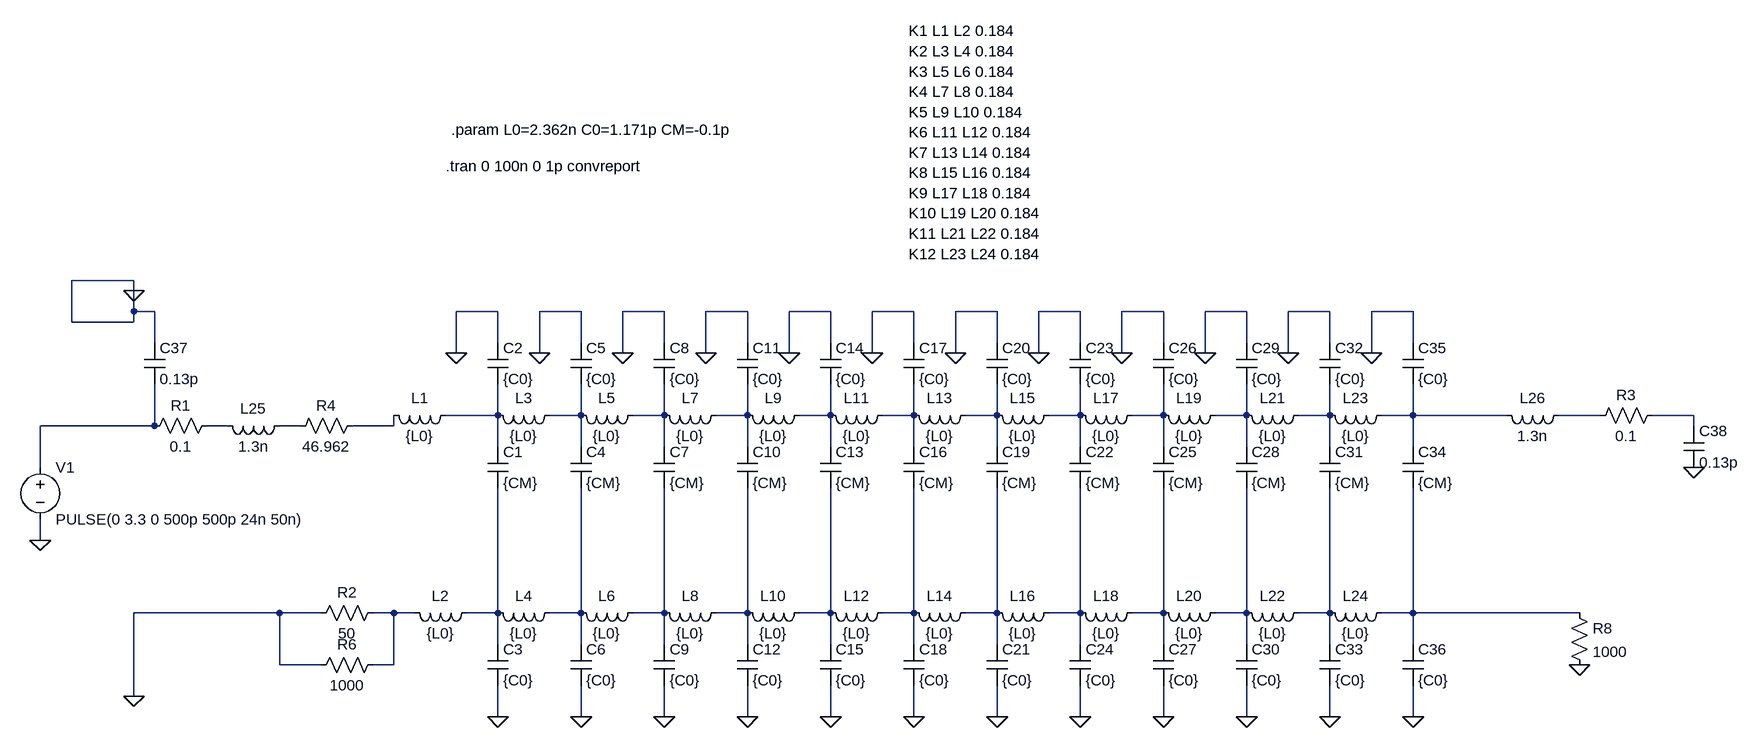
[diagram p0: schematic Assignment1_Microstrip.asc]
Assignment1_Microstrip.asc, the LTspice schematic file:
Version 4.1
SHEET 1 1612 952
WIRE -896 224 -992 224
WIRE -896 240 -896 224
WIRE -896 272 -896 240
WIRE -864 272 -896 272
WIRE -336 272 -400 272
WIRE -208 272 -272 272
WIRE -80 272 -144 272
WIRE 48 272 -16 272
WIRE 176 272 112 272
WIRE 304 272 240 272
WIRE 432 272 368 272
WIRE 560 272 496 272
WIRE 688 272 624 272
WIRE 816 272 752 272
WIRE 944 272 880 272
WIRE 1072 272 1008 272
WIRE -992 288 -992 224
WIRE -896 288 -896 272
WIRE -896 288 -992 288
WIRE -864 320 -864 272
WIRE -336 320 -336 272
WIRE -208 320 -208 272
WIRE -80 320 -80 272
WIRE 48 320 48 272
WIRE 176 320 176 272
WIRE 304 320 304 272
WIRE 432 320 432 272
WIRE 560 320 560 272
WIRE 688 320 688 272
WIRE 816 320 816 272
WIRE 944 320 944 272
WIRE 1072 320 1072 272
WIRE -400 336 -400 272
WIRE -272 336 -272 272
WIRE -144 336 -144 272
WIRE -16 336 -16 272
WIRE 112 336 112 272
WIRE 240 336 240 272
WIRE 368 336 368 272
WIRE 496 336 496 272
WIRE 624 336 624 272
WIRE 752 336 752 272
WIRE 880 336 880 272
WIRE 1008 336 1008 272
WIRE -336 432 -336 384
WIRE -336 432 -416 432
WIRE -208 432 -208 384
WIRE -208 432 -256 432
WIRE -80 432 -80 384
WIRE -80 432 -128 432
WIRE 48 432 48 384
WIRE 48 432 0 432
WIRE 176 432 176 384
WIRE 176 432 128 432
WIRE 304 432 304 384
WIRE 304 432 256 432
WIRE 432 432 432 384
WIRE 432 432 384 432
WIRE 560 432 560 384
WIRE 560 432 512 432
WIRE 688 432 688 384
WIRE 688 432 640 432
WIRE 816 432 816 384
WIRE 816 432 768 432
WIRE 944 432 944 384
WIRE 944 432 896 432
WIRE 1072 432 1072 384
WIRE 1072 432 1024 432
WIRE 1216 432 1072 432
WIRE 1360 432 1296 432
WIRE 1504 432 1440 432
WIRE -864 448 -864 384
WIRE -864 448 -1040 448
WIRE -752 448 -784 448
WIRE -640 448 -672 448
WIRE -496 448 -496 432
WIRE -496 448 -560 448
WIRE 1504 448 1504 432
WIRE -336 480 -336 432
WIRE -208 480 -208 432
WIRE -80 480 -80 432
WIRE 48 480 48 432
WIRE 176 480 176 432
WIRE 304 480 304 432
WIRE 432 480 432 432
WIRE 560 480 560 432
WIRE 688 480 688 432
WIRE 816 480 816 432
WIRE 944 480 944 432
WIRE 1072 480 1072 432
WIRE -1040 512 -1040 448
WIRE -1040 624 -1040 592
WIRE -672 736 -896 736
WIRE -608 736 -672 736
WIRE -496 736 -528 736
WIRE -464 736 -496 736
WIRE -336 736 -336 544
WIRE -336 736 -384 736
WIRE -208 736 -208 544
WIRE -208 736 -256 736
WIRE -80 736 -80 544
WIRE -80 736 -128 736
WIRE 48 736 48 544
WIRE 48 736 0 736
WIRE 176 736 176 544
WIRE 176 736 128 736
WIRE 304 736 304 544
WIRE 304 736 256 736
WIRE 432 736 432 544
WIRE 432 736 384 736
WIRE 560 736 560 544
WIRE 560 736 512 736
WIRE 688 736 688 544
WIRE 688 736 640 736
WIRE 816 736 816 544
WIRE 816 736 768 736
WIRE 944 736 944 544
WIRE 944 736 896 736
WIRE 1072 736 1072 544
WIRE 1072 736 1024 736
WIRE 1328 736 1072 736
WIRE -336 784 -336 736
WIRE -208 784 -208 736
WIRE -80 784 -80 736
WIRE 48 784 48 736
WIRE 176 784 176 736
WIRE 304 784 304 736
WIRE 432 784 432 736
WIRE 560 784 560 736
WIRE 688 784 688 736
WIRE 816 784 816 736
WIRE 944 784 944 736
WIRE 1072 784 1072 736
WIRE -672 816 -672 736
WIRE -608 816 -672 816
WIRE -496 816 -496 736
WIRE -496 816 -528 816
WIRE -896 864 -896 736
WIRE -336 896 -336 848
WIRE -208 896 -208 848
WIRE -80 896 -80 848
WIRE 48 896 48 848
WIRE 176 896 176 848
WIRE 304 896 304 848
WIRE 432 896 432 848
WIRE 560 896 560 848
WIRE 688 896 688 848
WIRE 816 896 816 848
WIRE 944 896 944 848
WIRE 1072 896 1072 848
FLAG -1040 624 0
FLAG -400 336 0
FLAG -336 896 0
FLAG -272 336 0
FLAG -208 896 0
FLAG -144 336 0
FLAG -80 896 0
FLAG -16 336 0
FLAG 48 896 0
FLAG 112 336 0
FLAG 176 896 0
FLAG 240 336 0
FLAG 304 896 0
FLAG 368 336 0
FLAG 432 896 0
FLAG 496 336 0
FLAG 560 896 0
FLAG 624 336 0
FLAG 688 896 0
FLAG 752 336 0
FLAG 816 896 0
FLAG 880 336 0
FLAG 944 896 0
FLAG 1008 336 0
FLAG 1072 896 0
FLAG -896 240 0
FLAG 1504 512 0
FLAG -896 864 0
FLAG 1328 816 0
SYMBOL voltage -1040 496 R0
WINDOW 123 0 0 Left 0
WINDOW 39 0 0 Left 0
SYMATTR InstName V1
SYMATTR Value PULSE(0 3.3 0 500p 500p 24n 50n)
SYMBOL res -768 432 R90
WINDOW 0 0 56 VBottom 2
WINDOW 3 32 56 VTop 2
SYMATTR InstName R1
SYMATTR Value 0.1
SYMBOL ind -400 416 R90
WINDOW 0 5 56 VBottom 2
WINDOW 3 32 56 VTop 2
SYMATTR InstName L1
SYMATTR Value {L0}
SYMATTR Type ind
SYMATTR SpiceLine Rser=1m
SYMBOL cap -352 480 R0
SYMATTR InstName C1
SYMATTR Value {CM}
SYMBOL cap -352 320 R0
SYMATTR InstName C2
SYMATTR Value {C0}
SYMBOL ind -368 720 R90
WINDOW 0 5 56 VBottom 2
WINDOW 3 32 56 VTop 2
SYMATTR InstName L2
SYMATTR Value {L0}
SYMATTR Type ind
SYMATTR SpiceLine Rser=1m
SYMBOL cap -352 784 R0
SYMATTR InstName C3
SYMATTR Value {C0}
SYMBOL ind -240 416 R90
WINDOW 0 5 56 VBottom 2
WINDOW 3 32 56 VTop 2
SYMATTR InstName L3
SYMATTR Value {L0}
SYMATTR Type ind
SYMATTR SpiceLine Rser=1m
SYMBOL cap -224 480 R0
SYMATTR InstName C4
SYMATTR Value {CM}
SYMBOL cap -224 320 R0
SYMATTR InstName C5
SYMATTR Value {C0}
SYMBOL ind -240 720 R90
WINDOW 0 5 56 VBottom 2
WINDOW 3 32 56 VTop 2
SYMATTR InstName L4
SYMATTR Value {L0}
SYMATTR Type ind
SYMATTR SpiceLine Rser=1m
SYMBOL cap -224 784 R0
SYMATTR InstName C6
SYMATTR Value {C0}
SYMBOL ind -112 416 R90
WINDOW 0 5 56 VBottom 2
WINDOW 3 32 56 VTop 2
SYMATTR InstName L5
SYMATTR Value {L0}
SYMATTR Type ind
SYMATTR SpiceLine Rser=1m
SYMBOL cap -96 480 R0
SYMATTR InstName C7
SYMATTR Value {CM}
SYMBOL cap -96 320 R0
SYMATTR InstName C8
SYMATTR Value {C0}
SYMBOL ind -112 720 R90
WINDOW 0 5 56 VBottom 2
WINDOW 3 32 56 VTop 2
SYMATTR InstName L6
SYMATTR Value {L0}
SYMATTR Type ind
SYMATTR SpiceLine Rser=1m
SYMBOL cap -96 784 R0
SYMATTR InstName C9
SYMATTR Value {C0}
SYMBOL ind 16 416 R90
WINDOW 0 5 56 VBottom 2
WINDOW 3 32 56 VTop 2
SYMATTR InstName L7
SYMATTR Value {L0}
SYMATTR Type ind
SYMATTR SpiceLine Rser=1m
SYMBOL cap 32 480 R0
SYMATTR InstName C10
SYMATTR Value {CM}
SYMBOL cap 32 320 R0
SYMATTR InstName C11
SYMATTR Value {C0}
SYMBOL ind 16 720 R90
WINDOW 0 5 56 VBottom 2
WINDOW 3 32 56 VTop 2
SYMATTR InstName L8
SYMATTR Value {L0}
SYMATTR Type ind
SYMATTR SpiceLine Rser=1m
SYMBOL cap 32 784 R0
SYMATTR InstName C12
SYMATTR Value {C0}
SYMBOL ind 144 416 R90
WINDOW 0 5 56 VBottom 2
WINDOW 3 32 56 VTop 2
SYMATTR InstName L9
SYMATTR Value {L0}
SYMATTR Type ind
SYMATTR SpiceLine Rser=1m
SYMBOL cap 160 480 R0
SYMATTR InstName C13
SYMATTR Value {CM}
SYMBOL cap 160 320 R0
SYMATTR InstName C14
SYMATTR Value {C0}
SYMBOL ind 144 720 R90
WINDOW 0 5 56 VBottom 2
WINDOW 3 32 56 VTop 2
SYMATTR InstName L10
SYMATTR Value {L0}
SYMATTR Type ind
SYMATTR SpiceLine Rser=1m
SYMBOL cap 160 784 R0
SYMATTR InstName C15
SYMATTR Value {C0}
SYMBOL ind 272 416 R90
WINDOW 0 5 56 VBottom 2
WINDOW 3 32 56 VTop 2
SYMATTR InstName L11
SYMATTR Value {L0}
SYMATTR Type ind
SYMATTR SpiceLine Rser=1m
SYMBOL cap 288 480 R0
SYMATTR InstName C16
SYMATTR Value {CM}
SYMBOL cap 288 320 R0
SYMATTR InstName C17
SYMATTR Value {C0}
SYMBOL ind 272 720 R90
WINDOW 0 5 56 VBottom 2
WINDOW 3 32 56 VTop 2
SYMATTR InstName L12
SYMATTR Value {L0}
SYMATTR Type ind
SYMATTR SpiceLine Rser=1m
SYMBOL cap 288 784 R0
SYMATTR InstName C18
SYMATTR Value {C0}
SYMBOL ind 400 416 R90
WINDOW 0 5 56 VBottom 2
WINDOW 3 32 56 VTop 2
SYMATTR InstName L13
SYMATTR Value {L0}
SYMATTR Type ind
SYMATTR SpiceLine Rser=1m
SYMBOL cap 416 480 R0
SYMATTR InstName C19
SYMATTR Value {CM}
SYMBOL cap 416 320 R0
SYMATTR InstName C20
SYMATTR Value {C0}
SYMBOL ind 400 720 R90
WINDOW 0 5 56 VBottom 2
WINDOW 3 32 56 VTop 2
SYMATTR InstName L14
SYMATTR Value {L0}
SYMATTR Type ind
SYMATTR SpiceLine Rser=1m
SYMBOL cap 416 784 R0
SYMATTR InstName C21
SYMATTR Value {C0}
SYMBOL ind 528 416 R90
WINDOW 0 5 56 VBottom 2
WINDOW 3 32 56 VTop 2
SYMATTR InstName L15
SYMATTR Value {L0}
SYMATTR Type ind
SYMATTR SpiceLine Rser=1m
SYMBOL cap 544 480 R0
SYMATTR InstName C22
SYMATTR Value {CM}
SYMBOL cap 544 320 R0
SYMATTR InstName C23
SYMATTR Value {C0}
SYMBOL ind 528 720 R90
WINDOW 0 5 56 VBottom 2
WINDOW 3 32 56 VTop 2
SYMATTR InstName L16
SYMATTR Value {L0}
SYMATTR Type ind
SYMATTR SpiceLine Rser=1m
SYMBOL cap 544 784 R0
SYMATTR InstName C24
SYMATTR Value {C0}
SYMBOL ind 656 416 R90
WINDOW 0 5 56 VBottom 2
WINDOW 3 32 56 VTop 2
SYMATTR InstName L17
SYMATTR Value {L0}
SYMATTR Type ind
SYMATTR SpiceLine Rser=1m
SYMBOL cap 672 480 R0
SYMATTR InstName C25
SYMATTR Value {CM}
SYMBOL cap 672 320 R0
SYMATTR InstName C26
SYMATTR Value {C0}
SYMBOL ind 656 720 R90
WINDOW 0 5 56 VBottom 2
WINDOW 3 32 56 VTop 2
SYMATTR InstName L18
SYMATTR Value {L0}
SYMATTR Type ind
SYMATTR SpiceLine Rser=1m
SYMBOL cap 672 784 R0
SYMATTR InstName C27
SYMATTR Value {C0}
SYMBOL ind 784 416 R90
WINDOW 0 5 56 VBottom 2
WINDOW 3 32 56 VTop 2
SYMATTR InstName L19
SYMATTR Value {L0}
SYMATTR Type ind
SYMATTR SpiceLine Rser=1m
SYMBOL cap 800 480 R0
SYMATTR InstName C28
SYMATTR Value {CM}
SYMBOL cap 800 320 R0
SYMATTR InstName C29
SYMATTR Value {C0}
SYMBOL ind 784 720 R90
WINDOW 0 5 56 VBottom 2
WINDOW 3 32 56 VTop 2
SYMATTR InstName L20
SYMATTR Value {L0}
SYMATTR Type ind
SYMATTR SpiceLine Rser=1m
SYMBOL cap 800 784 R0
SYMATTR InstName C30
SYMATTR Value {C0}
SYMBOL ind 912 416 R90
WINDOW 0 5 56 VBottom 2
WINDOW 3 32 56 VTop 2
SYMATTR InstName L21
SYMATTR Value {L0}
SYMATTR Type ind
SYMATTR SpiceLine Rser=1m
SYMBOL cap 928 480 R0
SYMATTR InstName C31
SYMATTR Value {CM}
SYMBOL cap 928 320 R0
SYMATTR InstName C32
SYMATTR Value {C0}
SYMBOL ind 912 720 R90
WINDOW 0 5 56 VBottom 2
WINDOW 3 32 56 VTop 2
SYMATTR InstName L22
SYMATTR Value {L0}
SYMATTR Type ind
SYMATTR SpiceLine Rser=1m
SYMBOL cap 928 784 R0
SYMATTR InstName C33
SYMATTR Value {C0}
SYMBOL ind 1040 416 R90
WINDOW 0 5 56 VBottom 2
WINDOW 3 32 56 VTop 2
SYMATTR InstName L23
SYMATTR Value {L0}
SYMATTR Type ind
SYMATTR SpiceLine Rser=1m
SYMBOL cap 1056 480 R0
SYMATTR InstName C34
SYMATTR Value {CM}
SYMBOL cap 1056 320 R0
SYMATTR InstName C35
SYMATTR Value {C0}
SYMBOL ind 1040 720 R90
WINDOW 0 5 56 VBottom 2
WINDOW 3 32 56 VTop 2
SYMATTR InstName L24
SYMATTR Value {L0}
SYMATTR Type ind
SYMATTR SpiceLine Rser=1m
SYMBOL cap 1056 784 R0
SYMATTR InstName C36
SYMATTR Value {C0}
SYMBOL ind -656 432 R90
WINDOW 0 5 56 VBottom 2
WINDOW 3 32 56 VTop 2
SYMATTR InstName L25
SYMATTR Value 1.3n
SYMATTR SpiceLine Rser=0
SYMBOL cap -880 320 R0
SYMATTR InstName C37
SYMATTR Value 0.13p
SYMBOL ind 1312 416 R90
WINDOW 0 5 56 VBottom 2
WINDOW 3 32 56 VTop 2
SYMATTR InstName L26
SYMATTR Value 1.3n
SYMATTR SpiceLine Rser=0
SYMBOL res 1456 416 R90
WINDOW 0 0 56 VBottom 2
WINDOW 3 32 56 VTop 2
SYMATTR InstName R3
SYMATTR Value 0.1
SYMBOL cap 1488 448 R0
SYMATTR InstName C38
SYMATTR Value 0.13p
SYMBOL res -544 432 R90
WINDOW 0 0 56 VBottom 2
WINDOW 3 32 56 VTop 2
SYMATTR InstName R4
SYMATTR Value 46.962
SYMBOL res -512 720 R90
WINDOW 0 0 56 VBottom 2
WINDOW 3 32 56 VTop 2
SYMATTR InstName R2
SYMATTR Value 50
SYMBOL res -512 800 R90
WINDOW 0 0 56 VBottom 2
WINDOW 3 32 56 VTop 2
SYMATTR InstName R6
SYMATTR Value 1000
SYMBOL res 1312 720 R0
SYMATTR InstName R8
SYMATTR Value 1000
TEXT -408 -8 Left 2 !.param L0=2.362n C0=1.171p CM=-0.1p
TEXT -416 48 Left 2 !.tran 0 100n 0 1p convreport
TEXT 296 -160 Left 2 !K1 L1 L2 0.184\nK2 L3 L4 0.184\nK3 L5 L6 0.184\nK4 L7 L8 0.184\nK5 L9 L10 0.184\nK6 L11 L12 0.184\nK7 L13 L14 0.184\nK8 L15 L16 0.184\nK9 L17 L18 0.184\nK10 L19 L20 0.184\nK11 L21 L22 0.184\nK12 L23 L24 0.184

The netlist it stands for:
* Assignment1_Microstrip.asc
V1 N015 0 PULSE(0 3.3 0 500p 500p 24n 50n)
R1 N016 N015 0.1
L1 N001 N018 {L0} Rser=1m
C1 N001 N020 {CM}
C2 0 N001 {C0}
L2 N020 N019 {L0} Rser=1m
C3 N020 0 {C0}
L3 N002 N001 {L0} Rser=1m
C4 N002 N021 {CM}
C5 0 N002 {C0}
L4 N021 N020 {L0} Rser=1m
C6 N021 0 {C0}
L5 N003 N002 {L0} Rser=1m
C7 N003 N022 {CM}
C8 0 N003 {C0}
L6 N022 N021 {L0} Rser=1m
C9 N022 0 {C0}
L7 N004 N003 {L0} Rser=1m
C10 N004 N023 {CM}
C11 0 N004 {C0}
L8 N023 N022 {L0} Rser=1m
C12 N023 0 {C0}
L9 N005 N004 {L0} Rser=1m
C13 N005 N024 {CM}
C14 0 N005 {C0}
L10 N024 N023 {L0} Rser=1m
C15 N024 0 {C0}
L11 N006 N005 {L0} Rser=1m
C16 N006 N025 {CM}
C17 0 N006 {C0}
L12 N025 N024 {L0} Rser=1m
C18 N025 0 {C0}
L13 N007 N006 {L0} Rser=1m
C19 N007 N026 {CM}
C20 0 N007 {C0}
L14 N026 N025 {L0} Rser=1m
C21 N026 0 {C0}
L15 N008 N007 {L0} Rser=1m
C22 N008 N027 {CM}
C23 0 N008 {C0}
L16 N027 N026 {L0} Rser=1m
C24 N027 0 {C0}
L17 N009 N008 {L0} Rser=1m
C25 N009 N028 {CM}
C26 0 N009 {C0}
L18 N028 N027 {L0} Rser=1m
C27 N028 0 {C0}
L19 N010 N009 {L0} Rser=1m
C28 N010 N029 {CM}
C29 0 N010 {C0}
L20 N029 N028 {L0} Rser=1m
C30 N029 0 {C0}
L21 N011 N010 {L0} Rser=1m
C31 N011 N030 {CM}
C32 0 N011 {C0}
L22 N030 N029 {L0} Rser=1m
C33 N030 0 {C0}
L23 N012 N011 {L0} Rser=1m
C34 N012 N031 {CM}
C35 0 N012 {C0}
L24 N031 N030 {L0} Rser=1m
C36 N031 0 {C0}
L25 N017 N016 1.3n Rser=0
C37 0 N015 0.13p
L26 N013 N012 1.3n Rser=0
R3 N014 N013 0.1
C38 N014 0 0.13p
R4 N018 N017 46.962
R2 N019 0 50
R6 N019 0 1000
R8 N031 0 1000
.param L0=2.362n C0=1.171p CM=-0.1p
.tran 0 100n 0 1p convreport
K1 L1 L2 0.184
K2 L3 L4 0.184
K3 L5 L6 0.184
K4 L7 L8 0.184
K5 L9 L10 0.184
K6 L11 L12 0.184
K7 L13 L14 0.184
K8 L15 L16 0.184
K9 L17 L18 0.184
K10 L19 L20 0.184
K11 L21 L22 0.184
K12 L23 L24 0.184
.backanno
.end